# Altium schematic sheet Top_Sheet.SchDoc
size A
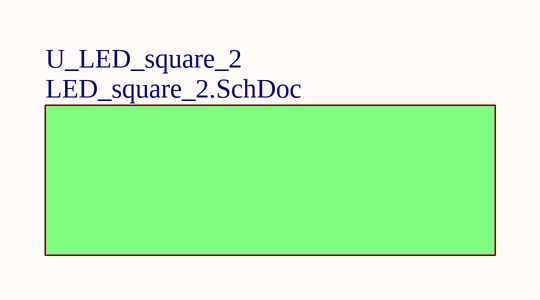
[diagram p0: Top_Sheet.SchDoc]

## Sub-sheets
U_LED_square_2 = LED_square_2.SchDoc: no entries